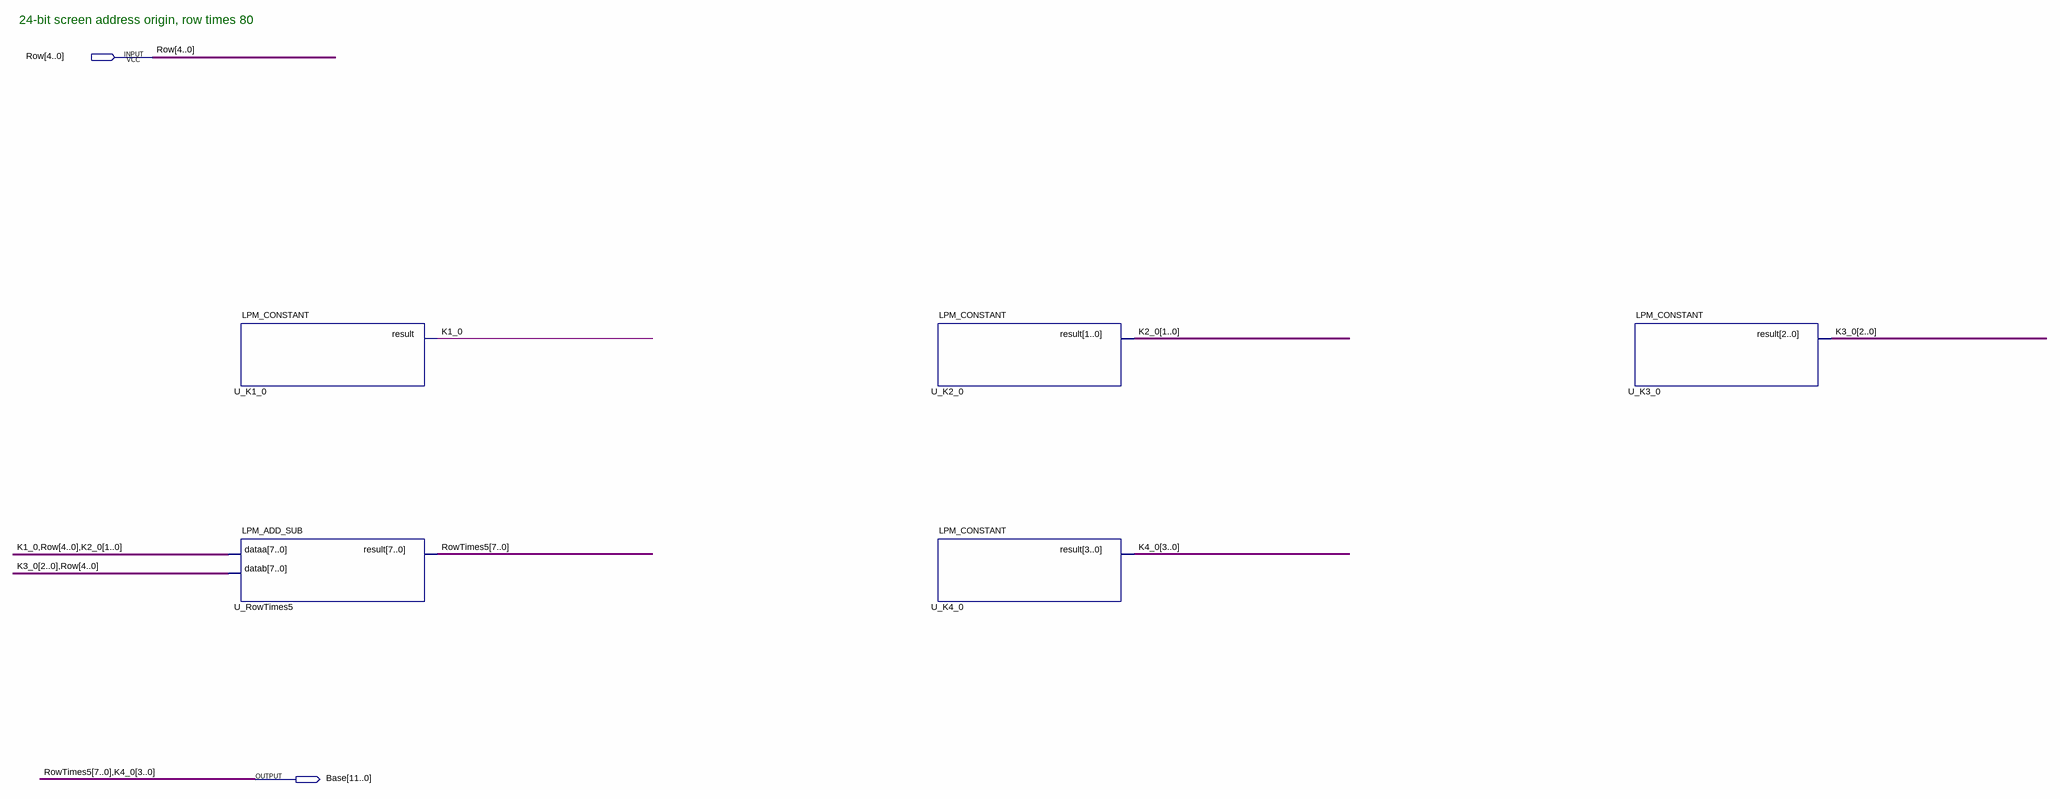
[diagram p0: schematic sheet]
// Quartus schematic Row_Base.bdf as structural Verilog: 5 symbols, 2 pins
module Row_Base (
  input  [4:0] Row,
  output [11:0] Base
);

  wire K1_0;
  wire [1:0] K2_0;
  wire [2:0] K3_0;

  LPM_CONSTANT #(.LPM_WIDTH(1), .LPM_CVALUE(0)) U_K1_0 (.result(K1_0));
  LPM_ADD_SUB #(.LPM_WIDTH(8), .LPM_DIRECTION("ADD"), .LPM_REPRESENTATION("UNSIGNED")) U_RowTimes5 (
    .dataa({K1_0, Row, K2_0}), .datab({K3_0, Row}), .result(Base[11:4]));
  LPM_CONSTANT #(.LPM_WIDTH(2), .LPM_CVALUE(0)) U_K2_0 (.result(K2_0));
  LPM_CONSTANT #(.LPM_WIDTH(4), .LPM_CVALUE(0)) U_K4_0 (.result(Base[3:0]));
  LPM_CONSTANT #(.LPM_WIDTH(3), .LPM_CVALUE(0)) U_K3_0 (.result(K3_0));

  // Other names for the same wires on the sheet: K4_0[3:0] = Base[3:0]; RowTimes5[7:0] = Base[11:4]

  // Notes on the sheet:
  //   24-bit screen address origin, row times 80
endmodule
